# EAGLE design rear-port-adb (EAGLE 9.7.0)
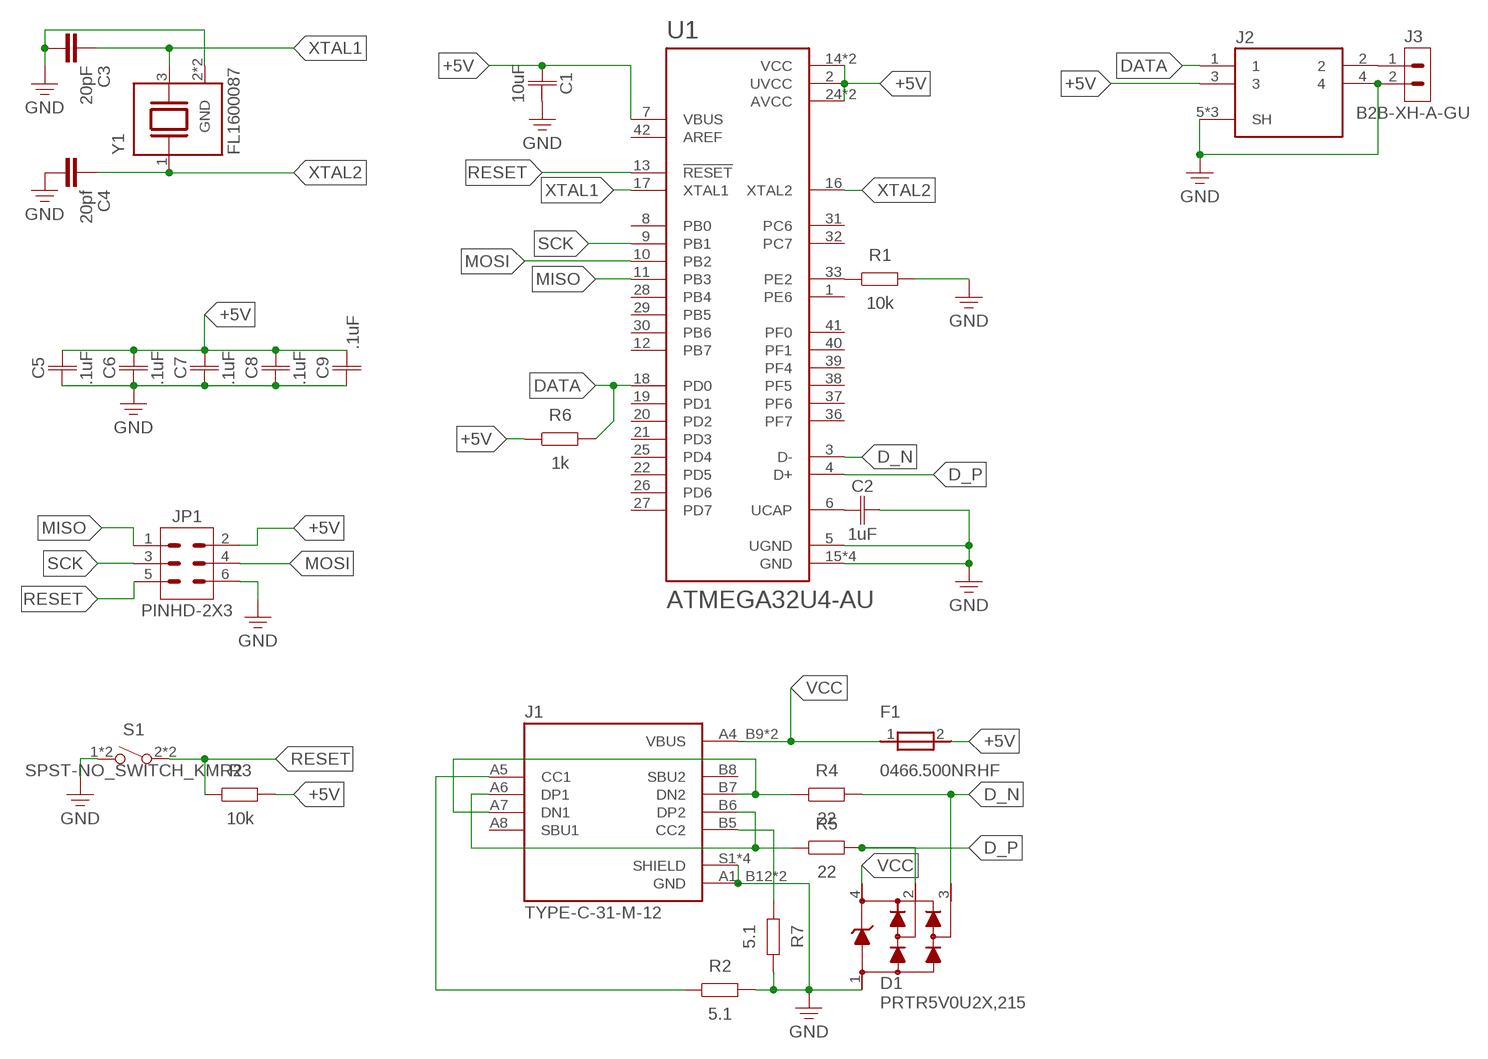
[diagram p0: schematic, sheet 1]

## Parts
C1  10uF  C_CHIP-0402(1005-METRIC)  [CAPC1005X60]
C2  1uF  C_CHIP-0402(1005-METRIC)  [CAPC1005X60]
C3  20pF  C_CHIP-0402(1005-METRIC)  [CAPC1005X60]
C4  20pf  C_CHIP-0402(1005-METRIC)  [CAPC1005X60]
C5  .1uF  C_CHIP-0402(1005-METRIC)  [CAPC1005X60]
C6  .1uF  C_CHIP-0402(1005-METRIC)  [CAPC1005X60]
C7  .1uF  C_CHIP-0402(1005-METRIC)  [CAPC1005X60]
C8  .1uF  C_CHIP-0402(1005-METRIC)  [CAPC1005X60]
C9  .1uF  C_CHIP-0402(1005-METRIC)  [CAPC1005X60]
D1  PRTR5V0U2X,215  [SOT143B]
F1  0466.500NRHF  [FUSC3115X66N]
J1  TYPE-C-31-M-12  [HRO_TYPE-C-31-M-12]
J2  5749181-1  [TE_5749181-1]
J3  B2B-XH-A-GU  [B2B-XH-A-GU]
JP1  PINHD-2X3  [2X03]
R1  10k  R_CHIP-0402(1005-METRIC)  [RESC1005X40]
R2  5.1  R_CHIP-0402(1005-METRIC)  [RESC1005X40]
R3  10k  R_CHIP-0402(1005-METRIC)  [RESC1005X40]
R4  22  R_CHIP-0402(1005-METRIC)  [RESC1005X40]
R5  22  R_CHIP-0402(1005-METRIC)  [RESC1005X40]
R6  1k  R_CHIP-0402(1005-METRIC)  [RESC1005X40]
R7  5.1  R_CHIP-0402(1005-METRIC)  [RESC1005X40]
S1  SPST-NO_SWITCH_KMR2  [KMR2]
U1  ATMEGA32U4-AU  [QFP80P1200X1200X120-44N]
Y1  FL1600087  [XTAL_FL1600087]

## Nets
+5V: C1.1 C5.2 C6.2 C7.2 C8.2 C9.2 F1.2 J2.3 JP1.2 R3.2 R6.1 U1.2(UVCC) U1.7(VBUS) U1.14(VCC) U1.24(AVCC) U1.34(VCC) U1.44(AVCC)
CC1: J1.A5(CC1) R2.1
CC2: J1.B5(CC2) R7.1
D_N: D1.3 R4.2 U1.3(D-)
D_P: D1.2 R5.2 U1.4(D+)
DATA: J2.1 R6.2 U1.18(PD0)
GND: C1.2 C2.2 C3.2 C4.2 C5.1 C6.1 C7.1 C8.1 C9.1 D1.1 J1.A1_B12(GND) J1.B1_A12(GND) J1.S1(SHIELD) J1.S2(SHIELD) J1.S3(SHIELD) J1.S4(SHIELD) J2.4 J2.5(SH) J2.6(SH) J2.7(SH) J3.2 JP1.6 R1.2 R2.2 R7.2 S1.1 S1.4 U1.5(UGND) U1.15(GND) U1.23(GND) U1.35(GND) U1.43(GND) Y1.2(GND) Y1.4(GND)
MISO: JP1.1 U1.11(PB3)
MOSI: JP1.4 U1.10(PB2)
N$1: R1.1 U1.33(PE2)
N$2: C2.1 U1.6(UCAP)
N$3: J1.A6(DP1) J1.B6(DP2) R5.1
N$4: J1.A7(DN1) J1.B7(DN2) R4.1
N$5: J2.2 J3.1
RESET: JP1.5 R3.1 S1.2 S1.3 U1.13(!RESET)
SCK: JP1.3 U1.9(PB1)
VCC: D1.4 F1.1 J1.A4_B9(VBUS) J1.B4_A9(VBUS)
XTAL1: C3.1 U1.17(XTAL1) Y1.3
XTAL2: C4.1 U1.16(XTAL2) Y1.1
Unconnected: J1.A8(SBU1) J1.B8(SBU2) U1.1(PE6) U1.8(PB0) U1.12(PB7) U1.19(PD1) U1.20(PD2) U1.21(PD3) U1.22(PD5) U1.25(PD4) U1.26(PD6) U1.27(PD7) U1.28(PB4) U1.29(PB5) U1.30(PB6) U1.31(PC6) U1.32(PC7) U1.36(PF7) U1.37(PF6) U1.38(PF5) U1.39(PF4) U1.40(PF1) U1.41(PF0) U1.42(AREF)

## Library data of the parts
C1 C2 C5-C9 = Capacitor:C: Capacitor - Generic; CATEGORY: Capacitor; PACKAGE_SIZE: 0402; PACKAGE_TYPE: Surface Mount; SUBCATEGORY: Ceramic Capacitors; TYPE: MLCC
C3 C4 = Tutorial - Fusion 360:C: Capacitor - Generic; CATEGORY: Capacitor
D1 = PRTR5V0U2X_215:PRTR5V0U2X,215: Check availability <https://pricing.snapeda.com/parts/PRTR5V0U2X%2C215/Nexperia%20USA/view-part?ref=eda>; AVAILABILITY: In Stock; CHECK_PRICES: https://www.snapeda.com/parts/PRTR5V0U2X,215/Nexperia/view-part/?ref=eda; DESCRIPTION: - Clamp - Ipp Tvs Diode Surface Mount SOT-143B; MF: Nexperia USA; MP: PRTR5V0U2X,215; PACKAGE: SOT143B-4 Nexperia USA Inc.; PRICE: None; SNAPEDA_LINK: https://www.snapeda.com/parts/PRTR5V0U2X,215/Nexperia/view-part/?ref=snap
F1 = FUSC3115X66N:0466.500NRHF: Check availability <https://pricing.snapeda.com/parts/0466.500NRHF/Littelfuse%20Inc./view-part?ref=eda>; AVAILABILITY: In Stock; CHECK_PRICES: https://www.snapeda.com/parts/0466.500NRHF/Littelfuse/view-part/?ref=eda; DESCRIPTION: 470 Series 1206 Fast-Acting Fuse; MF: Littelfuse Inc.; MP: 0466.500NRHF; PACKAGE: 1206 Littelfuse Inc.; PRICE: None; SNAPEDA_LINK: https://www.snapeda.com/parts/0466.500NRHF/Littelfuse/view-part/?ref=snap
J1 = TYPE-C-31-M-12:TYPE-C-31-M-12: Check availability <https://pricing.snapeda.com/parts/TYPE-C-31-M-12/HRO%20Electronics%20Co.%2C%20Ltd./view-part?ref=eda>; AVAILABILITY: Not in stock; CHECK_PRICES: https://www.snapeda.com/parts/TYPE-C-31-M-12/HRO+Electronics+Co.%252C+Ltd./view-part/?ref=eda; DESCRIPTION: USB Connectors 24 Receptacle 1 8.94*7.3mm RoHS; MF: HRO Electronics Co., Ltd.; MP: TYPE-C-31-M-12; PACKAGE: Package; PRICE: None; SNAPEDA_LINK: https://www.snapeda.com/parts/TYPE-C-31-M-12/HRO+Electronics+Co.%252C+Ltd./view-part/?ref=snap
J2 = Mini Din 4 POS 5749181-1:5749181-1: Check availability <https://pricing.snapeda.com/parts/5749181-1/TE%20Connectivity/view-part?ref=eda>; AVAILABILITY: In Stock; CHECK_PRICES: https://www.snapeda.com/parts/5749181-1/TE+Connectivity+AMP+Connectors/view-part/?ref=eda; COMMENT: 5749181-1; DESCRIPTION: Connector, Mini Circular DIN, Recept. Assy w/Hold Down, 4 Pos, PCB Mnt, Rt Angle | TE Connectivity 5749181-1; EU_ROHS_COMPLIANCE: Compliant; MF: TE Connectivity; MP: 5749181-1; PACKAGE: None; PRICE: None; SNAPEDA_LINK: https://www.snapeda.com/parts/5749181-1/TE+Connectivity+AMP+Connectors/view-part/?ref=snap
J3 = JST B2B-XA-A-GU:B2B-XH-A-GU: XH Connector Top Entry - 2POS Reference: : Datasheet <http://www.jst-mfg.com/product/pdf/eng/eXH.pdf>; CATEGORY: Connectors; DATASHEET: https://www.jst-mfg.com/product/pdf/eng/eXH.pdf; DESCRIPTION: Connector Header Through Hole 2 position 0.098" (2.50mm); MANUFACTURER: JST Sales America Inc.; MPN: B2B-XH-A; OPERATING_TEMPERATURE: -25°C ~ 85°C; PACKAGE_SIZE: NA; PACKAGE_TYPE: Through Hole; PART_STATUS: Active; PITCH: 0.098" (2.50mm); ROHS: Compliant; SERIES: XH; SUBCATEGORY: Rectangular Connectors; TYPE: Male Headers
JP1 = JST B2B-XA-A-GU:PINHD-2X3: Pin Header; CATEGORY: Connectors; DESCRIPTION: Header-Straight-2x3 Position; PACKAGE_TYPE: Through Hole; PITCH: 0.100" (2.54mm); SUBCATEGORY: Headers; TYPE: Male Pins
R1-R7 = Resistor:R: Resistor Fixed - Generic; CATEGORY: Resistors; DESCRIPTION: Chip Resistor 1.05 X 0.54 X 0.40 mm body 0402(1005-METRIC) Package; PACKAGE_SIZE: 0402; PACKAGE_TYPE: Surface Mount
S1 = Switch:SPST-NO_SWITCH: SPST Switches with NO Configuration; CATEGORY: Switches; DATASHEET: https://www.ckswitches.com/media/1479/kmr2.pdf; DESCRIPTION: Tactile Switch SPST-NO Top Actuated Surface Mount; MANUFACTURER: C&K; MPN: KMR211G LFS; OPERATING_TEMPERATURE: -40°C ~ 85°C; PACKAGE_SIZE: NA; PACKAGE_TYPE: Surface Mount; PART_STATUS: Active; ROHS: Compliant; SERIES: KMR2; SUBCATEGORY: Tactile Switches; TYPE: SPST-NO
U1 = ATMEGA32U4-AU:ATMEGA32U4-AU: Check availability <https://pricing.snapeda.com/parts/ATMEGA32U4-AU/Microchip%20Technology%20/%20Atmel/view-part?ref=eda>; AVAILABILITY: In Stock; CHECK_PRICES: https://www.snapeda.com/parts/ATMEGA32U4-AU/Microchip/view-part/?ref=eda; DESCRIPTION: AVR AVR® ATmega Microcontroller IC 8-Bit 16MHz 32KB (16K x 16) FLASH 44-TQFP (10x10); MF: Microchip Technology / Atmel; MP: ATMEGA32U4-AU; PACKAGE: TQFP-44 Microchip; PRICE: None; SNAPEDA_LINK: https://www.snapeda.com/parts/ATMEGA32U4-AU/Microchip/view-part/?ref=snap
Y1 = XTAL FL1600087:FL1600087: Check availability <https://pricing.snapeda.com/parts/FL1600087/Diodes%20Incorporated/view-part?ref=eda>; AVAILABILITY: In Stock; CHECK_PRICES: https://www.snapeda.com/parts/FL1600087/Diodes+Inc./view-part/?ref=eda; DESCRIPTION: Crystal 16MHz ±15ppm (Tol) ±15ppm (Stability) 20pF FUND 28.9Ohm 4-Pin SMD; MF: Diodes Incorporated; MP: FL1600087; PACKAGE: NON STANDARD-4 Diodes Inc.; PRICE: None; SNAPEDA_LINK: https://www.snapeda.com/parts/FL1600087/Diodes+Inc./view-part/?ref=snap

## Board
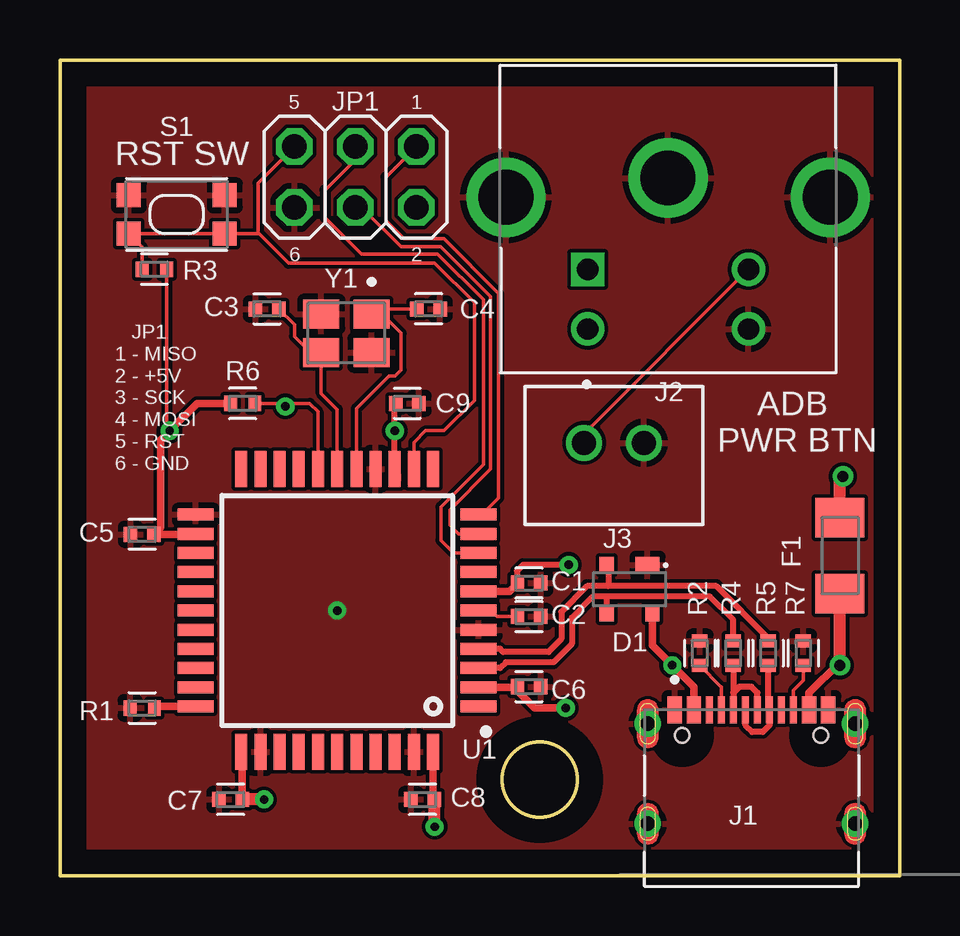
[diagram p1: board, top side]
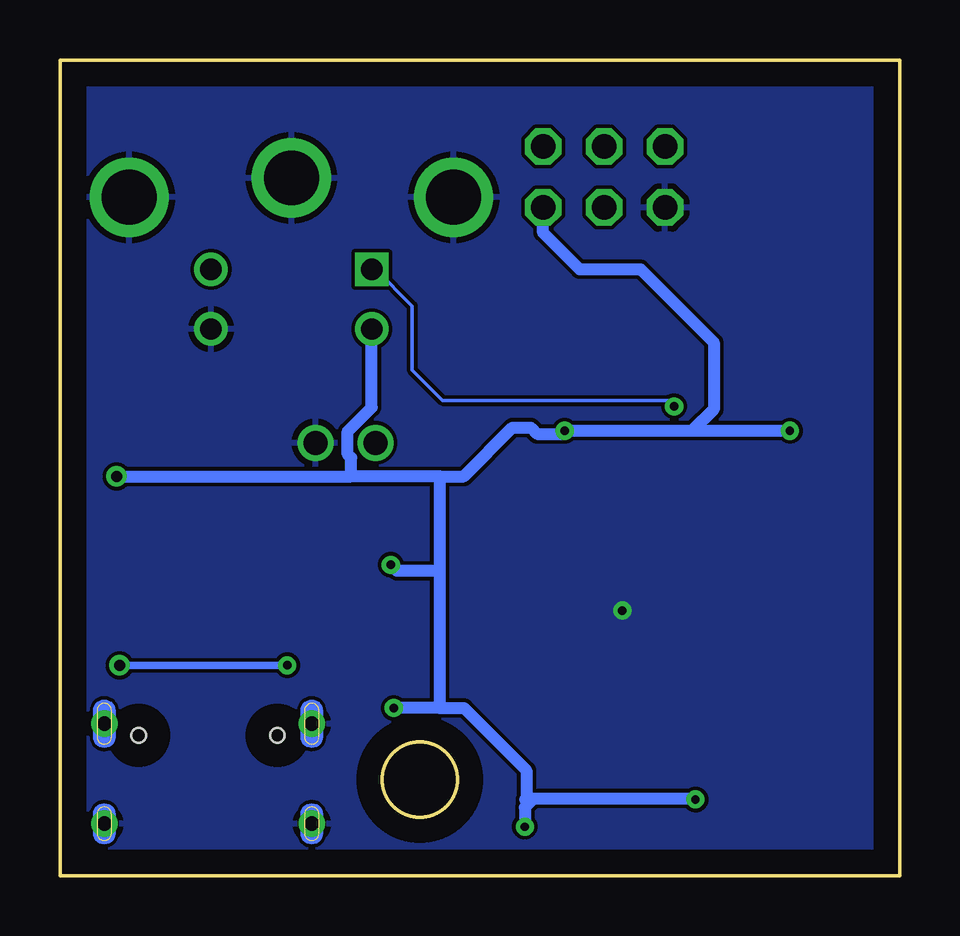
[diagram p2: board, bottom side, seen from below]

Size 35 x 34 mm. Coordinates in mm from the lower left corner, seen from the top.
Outline: 35,34 0,34 0,0 35,0 35,34
Outline: circle at 20,4 radius 1.55
Copper layers (1*16): Top 0.035mm / dielectric 1.5mm / Bottom 0.035mm
Design rules "Fusion Electronics Design Rules": minimum track width 6mil, minimum drill 0.35mm, track to track 6mil, track to pad 6mil, pad to pad 6mil, via to via 6mil, smd to smd 6mil, copper to edge 40mil, drill to drill 6mil, minimum pad ring 10mil, minimum via ring 8mil, stop-mask expansion 4mil, vias tented up to drill 9999mil, thermal gap 10mil

### Footprints (pad centres in the part's own frame; a part is rotated, then mirrored left to right if it is on the bottom)
CAPC1005X60 = smd 0.56 x 0.629: 1 -0.485,0; 2 0.485,0
SOT143B = smd 1 x 0.7: 1 -0.75,-1 | smd 0.6 x 0.7: 2 0.95,-1; 3 0.95,1; 4 -0.95,1
FUSC3115X66N = smd 1.65 x 2.03: 1 -1.59,0; 2 1.59,0
HRO_TYPE-C-31-M-12 = smd 0.6 x 1.14: A1_B12 -3.2,4.75; A4_B9 -2.4,4.75; B1_A12 3.2,4.75; B4_A9 2.4,4.75 | smd 0.3 x 1.14: A5 -1.25,4.75; A6 -0.25,4.75; A7 0.25,4.75; A8 1.25,4.75; B5 1.75,4.75; B6 0.75,4.75; B7 -0.75,4.75; B8 -1.75,4.75 | drill 0.6 pad 0.9: S1 -4.325,4.17; S2 4.325,4.17; S3 -4.325,0; S4 4.325,0 | hole 0.6: -2.89,3.68; 2.89,3.68
TE_5749181-1 = drill 0.89 square: 1 -3.35,0 | drill 0.89: 2 3.35,0; 3 -3.35,-2.49; 4 3.35,-2.49 | drill 2.29: 5 0,3.81; 6 6.76,3; 7 -6.76,3
B2B-XH-A-GU = drill 1: 1 0,0; 2 2.5,0
2X03 = drill 1.016 octagon: 1 -2.54,-1.27; 2 -2.54,1.27; 3 0,-1.27; 4 0,1.27; 5 2.54,-1.27; 6 2.54,1.27
RESC1005X40 = smd 0.535 x 0.644: 1 -0.507,0; 2 0.507,0
KMR2 = smd 1 x 1: 1 2,0.8; 2 2,-0.8; 3 -2,-0.8; 4 -2,0.8
QFP80P1200X1200X120-44N = smd 1.5 x 0.5: 1 -5.9,4; 2 -5.9,3.2; 3 -5.9,2.4; 4 -5.9,1.6; 5 -5.9,0.8; 6 -5.9,0; 7 -5.9,-0.8; 8 -5.9,-1.6; 9 -5.9,-2.4; 10 -5.9,-3.2; 11 -5.9,-4; 23 5.9,-4; 24 5.9,-3.2; 25 5.9,-2.4; 26 5.9,-1.6; 27 5.9,-0.8; 28 5.9,0; 29 5.9,0.8; 30 5.9,1.6; 31 5.9,2.4; 32 5.9,3.2; 33 5.9,4 | smd 0.5 x 1.5: 12 -4,-5.9; 13 -3.2,-5.9; 14 -2.4,-5.9; 15 -1.6,-5.9; 16 -0.8,-5.9; 17 0,-5.9; 18 0.8,-5.9; 19 1.6,-5.9; 20 2.4,-5.9; 21 3.2,-5.9; 22 4,-5.9; 34 4,5.9; 35 3.2,5.9; 36 2.4,5.9; 37 1.6,5.9; 38 0.8,5.9; 39 0,5.9; 40 -0.8,5.9; 41 -1.6,5.9; 42 -2.4,5.9; 43 -3.2,5.9; 44 -4,5.9
XTAL_FL1600087 = smd 1.2 x 1.5: 1 -0.8,1.05; 2 -0.8,-1.05; 3 0.8,-1.05; 4 0.8,1.05

### Placement (x,y rotation side)
C1  19.56,12.19 0 top
C2  19.56,10.79 0 top
C3  8.64,23.62 180 top
C4  15.37,23.62 0 top
C5  3.43,14.22 0 top
C6  19.56,7.87 180 top
C7  7.11,3.17 0 top
C8  15.11,3.17 0 top
C9  14.48,19.68 180 top
D1  23.75,11.94 180 top
F1  32.51,13.34 90 top
J1  28.83,2.16 0 top
J2  25.35,25.27 0 top
J3  21.84,18.03 0 top
JP1  12.32,29.12 180 top
R1  3.43,6.99 180 top
R2  26.67,9.27 90 top
R3  3.94,25.27 0 top
R4  28.07,9.27 90 top
R5  29.52,9.27 90 top
R6  7.62,19.68 0 top
R7  30.99,9.27 90 top
S1  4.86,27.56 0 top
U1  11.56,11.05 180 top
Y1  11.94,22.61 270 top

### Tracks (layer width: path | path; a pad name or v marks a point on that pad's centre or on a via)
+5V  (via drill 0.35, 0.45)
  Top 0.152: 13.96,19.65 C9.2 13.99,19.72 | 13.97,16.51 13.99,16.53 U1.14 | R3.2 4.44,18.67 v4.57,18.54
  Top 0.254: U1.14 v13.96,18.54 13.96,19.65 | v21.21,12.95 19.3,12.95 19.05,12.7 19.05,12.21
  Top 0.305: 32.51,16.64 v32.64,16.64 | 5.68,14.22 U1.24 5.63,14.22 C5.2 4.19,14.5 4.19,18.16 v4.57,18.54 5.71,19.68 R6.1 | C7.2 7.6,5.11 U1.34 | C8.2 15.56,3.22 U1.44 15.49,5.21 | U1.2 18.92,7.85 | 18.92,7.85 19.05,7.85 C6.2 | 17.42,11.81 U1.7 18.73,11.85 C1.1 | U1.14 13.97,16.94 | v21.08,6.99 19.79,6.99 18.92,7.85
  Top 0.508: F1.2 32.51,16.64 | U1.14 13.97,16.51 | v8.51,3.17 C7.2 | v15.62,2.03 15.62,3.15 C8.2 | 19.05,12.21 C1.1
  Bottom 0.508: 19.18,16.64 18.16,16.64 16.13,18.67 15.37,18.67 15.11,18.41 14.08,18.41 v13.96,18.54 8.64,18.54 | 19.18,16.64 22.86,16.64 | v32.64,16.64 22.86,16.64 | 8.64,18.54 v4.57,18.54 | 19.18,16.64 19.18,12.7 | 19.18,12.7 19.18,6.99 | C8.2 15.56,3.22 | 15.56,3.22 15.24,3.22 | 15.24,3.22 8.55,3.22 v8.51,3.17 | 19.18,6.99 v21.08,6.99 | 19.18,6.99 18.16,6.99 15.56,4.38 15.56,3.22 | 15.24,3.22 15.62,2.83 v15.62,2.03 | 19.18,12.7 20.95,12.7 v21.21,12.95 | JP1.2 14.86,26.8 13.34,25.27 10.79,25.27 7.75,22.23 7.75,19.43 8.64,18.54 | 22.86,16.64 22.86,17.41 23,17.55 23,18.52 22,19.52 J2.3
CC1
  Top 0.152: R2.1 27.56,7.88 27.58,7.85 J1.A5
CC2
  Top 0.152: R7.1 30.99,8.13 30.58,7.72 J1.B5
D_N
  Top 0.254: R4.2 28.07,10.67 27.1,11.63 22.86,11.63 | U1.3 18.35,8.65 18.59,8.89 20.57,8.89 21.34,9.65 21.34,10.74 22.22,11.63 22.86,11.63 | D1.3 22.8,11.57 22.86,11.63
D_P
  Top 0.254: R5.2 29.52,9.9 27.36,12.06 22.86,12.06 | 22.86,12.06 21.97,12.06 20.9,11 20.9,9.86 20.37,9.32 18.47,9.32 18.35,9.45 U1.4 | D1.2 22.86,12.88 22.86,12.06
DATA  (via drill 0.35)
  Top 0.152: U1.18 10.76,19.34 10.41,19.68 R6.2 9.27,19.68 v9.4,19.56
  Bottom 0.152: v9.4,19.56 9.65,19.81 19.05,19.81 20.32,21.08 20.32,23.75 21.84,25.27 J2.1
GND  (via drill 0.35)
  other vias: 11.56,11.05
  pour Top: 0.08,0.08 35.48,0.08 35.48,40.56 0.08,40.56
  pour Bottom: -1.19,0.08 35.48,0.08 35.48,40.56 -1.19,40.56
MISO
  Top 0.152: 17.58,14.92 17.52,14.98 | 17.52,14.98 U1.11 | JP1.1 13.59,29.12 13.59,27.3 14.35,26.54 16,26.54 18.29,24.26 18.29,15.75 17.52,14.98
MOSI
  Top 0.152: U1.10 16.61,14.25 16.26,14.61 16.26,15.24 17.96,16.94 17.96,24.13 15.87,26.21 14.21,26.21 12.57,27.85 JP1.4
N$1
  Top 0.305: R1.1 4,7.05 U1.33
N$2
  Top 0.152: U1.6 17.96,11.05 18.21,10.79 C2.1
N$3
  Top 0.152: 29.52,6.97 J1.B6
  Top 0.254: R5.1 29.52,6.97 | J1.A6 28.58,6.26 28.86,5.98 29.3,5.98 29.58,6.26 J1.B6
N$4
  Top 0.152: 28.07,6.92 J1.B7 | 28.12,8.76 R4.1 | 29.08,7.62
  Top 0.254: R4.1 28.07,7.62 | 28.07,7.62 28.07,6.92 | J1.A7 29.08,7.62 | 29.08,7.62 28.83,7.87 28.32,7.87 28.07,7.62
N$5
  Top 0.152: J2.2 21.84,18.41 J3.1
RESET
  Top 0.152: JP1.5 8.26,28.87 8.26,26.8 | 8.26,26.8 8.26,26.76 S1.2 S1.3 3.43,26.19 R3.1 | U1.13 14.76,18.06 15.24,18.54 16,18.54 17.27,19.81 17.27,23.88 15.62,25.53 9.53,25.53 8.26,26.8
SCK
  Top 0.152: 17.58,13.58 U1.9 16.4,13.45 15.88,13.97 15.88,15.37 17.65,17.14 17.65,24 15.75,25.91 12.57,25.91 11.05,27.43 11.05,28.57 12.32,29.84 JP1.3
VCC  (via drill 0.35, 0.45)
  Top 0.305: J1.A4_B9 26.43,7.86 v25.53,8.76 24.7,9.59 D1.4 | v32.51,8.76 32.51,8.89 31.23,7.61 J1.B4_A9
  Top 0.508: 32.51,8.89 F1.1
  Bottom 0.305: v25.53,8.76 v32.51,8.76
XTAL1
  Top 0.152: U1.17 11.56,19.43 10.89,20.1 Y1.3 10.45,21.81 | C3.1 9.78,22.96 9.78,22.48 10.45,21.81 | 10.25,21.81 10.45,21.81
XTAL2
  Top 0.152: U1.16 12.36,19.47 13.72,20.83 13.97,20.83 14.22,21.08 14.22,22.61 13.4,23.43 | 13.03,23.37 13.34,23.37 13.4,23.43 | C4.1 13.59,23.62 13.4,23.43 | 13.4,23.43 Y1.1 | Y1.1 13.03,23.37 | Y1.1 13.03,23.37 | Y1.1 13.4,23.43 | Y1.1 13.4,23.43

### Text on the board
tNames: 5 | 1 | RST SW | 6 | 2 | ADB / PWR BTN | JP1 / 1 - MISO / 2 - +5V / 3 - SCK / 4 - MOSI / 5 - RST / 6 - GND